# Altium schematic sheet MCU.SchDoc
size A3; SheetNumber: 4; SheetTotal: 7
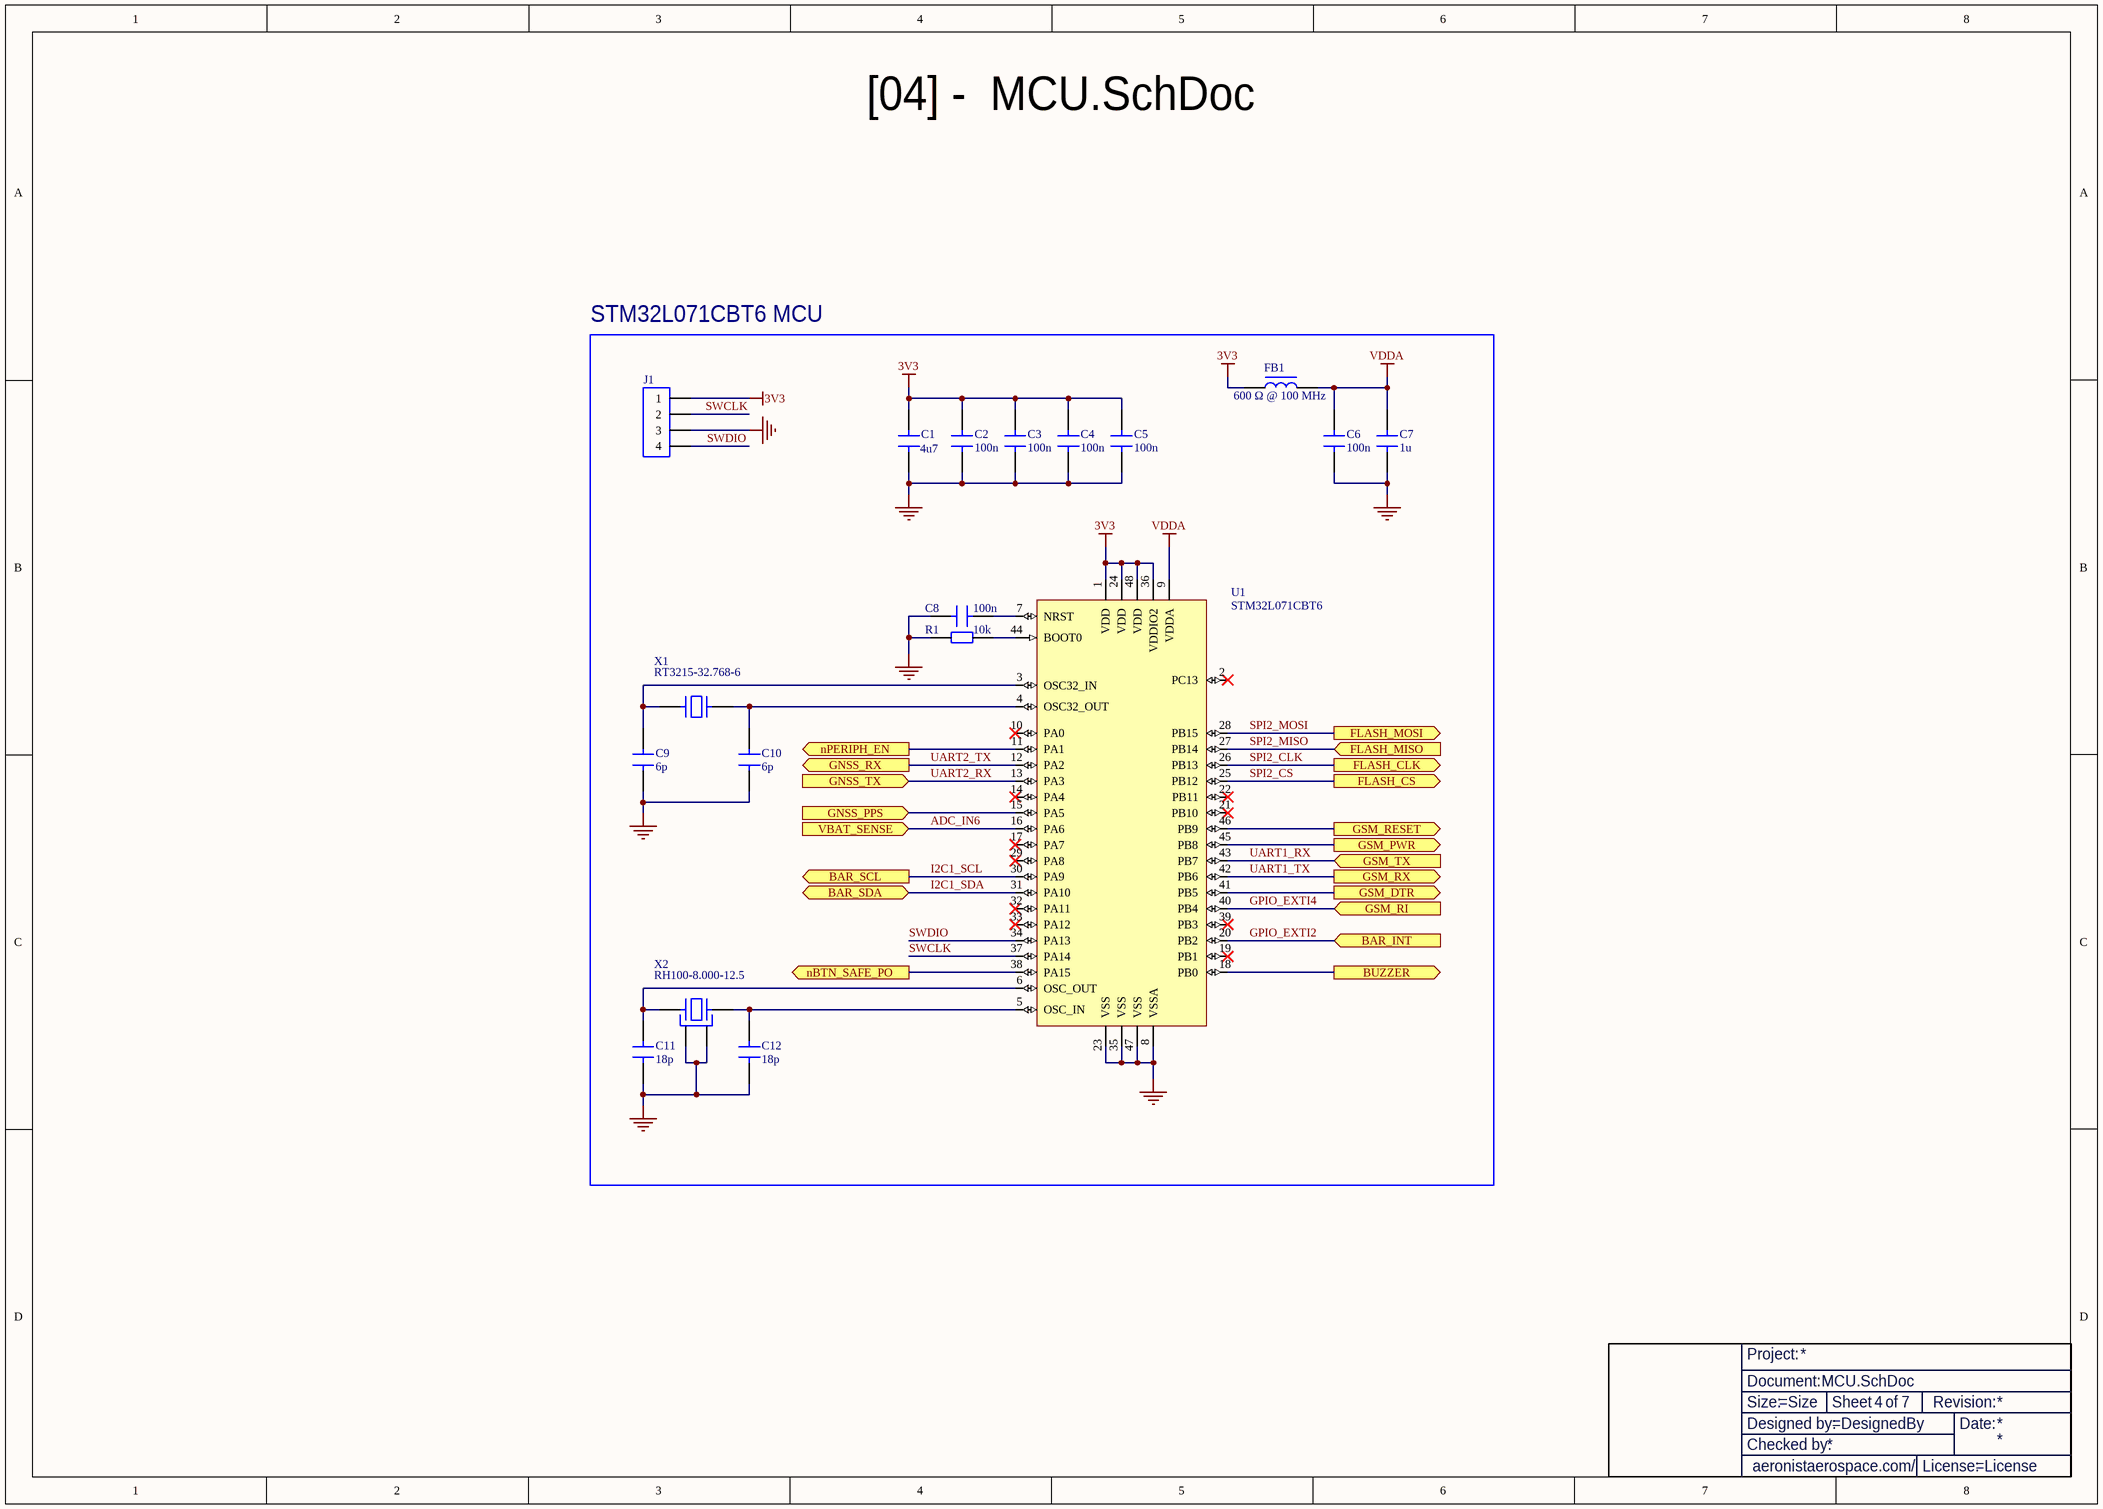
[diagram p0: MCU.SchDoc]

## Parts
?  Title Block  (value not drawn)  (graphical)
C1  4u7  [CAP 0603]
C2  100n  [CAP 0402]
C3  100n  [CAP 0402]
C4  100n  [CAP 0402]
C5  100n  [CAP 0402]
C6  100n  [CAP 0402]
C7  1u  [CAP 0603]
C8  100n  [CAP 0402]
C9  6p  [CAP 0402]
C10  6p  [CAP 0402]
C11  18p  [CAP 0402]
C12  18p  [CAP 0402]
FB1  600 Ω @ 100 MHz  [FB 0402]
J1  CONN 1x4 Pad 1.27mm  [CONN 1x4 PAD 1.27mm]  (value not drawn)
R1  10k  [RES 0402]
U1  STM32L071CBT6  [LQFP48]
X1  RT3215-32.768-6  [RT3215-32.768-X]
X2  RH100-8.000-12.5  [RH100]

## Blocks framed on the sheet
STM32L071CBT6 MCU: C1-C12 FB1 J1 R1 U1 X1 X2

## Ports
BAR_INT (in, see Peripherals[2C]), BAR_SCL (out, see Peripherals[4C]), BAR_SDA (bidir, see Peripherals[4C]), BUZZER (out, see Peripherals[5C]), FLASH_CLK (out, see Peripherals[5B]), FLASH_CS (out, see Peripherals[5B]), FLASH_MISO (in, see Peripherals[5B]), FLASH_MOSI (out, see Peripherals[5B]), GNSS_PPS (in, see Peripherals[3B]), GNSS_RX (out, see Peripherals[3B]), GNSS_TX (in, see Peripherals[3B]), GSM_DTR (out, see Telemetry[5D]), GSM_PWR (out, see Telemetry[5B]), GSM_RESET (out, see Telemetry[5C]), GSM_RI (in, see Telemetry[5D]), GSM_RX (out, see Telemetry[5D]), GSM_TX (in, see Telemetry[5D]), nBTN_SAFE_PO (out, see Telemetry[4C]), nPERIPH_EN (out, see Power[7C]), VBAT_SENSE (in, see Power[5C])

## Nets
3V3: C1.2 C2.2 C3.2 C4.2 C5.2 FB1.2 J1.1 U1.1(VDD) U1.24(VDD) U1.36(VDDIO2) U1.48(VDD)
GND: C1.1 C2.1 C3.1 C4.1 C5.1 C6.1 C7.1 C8.2 C9.1 C10.1 C11.1 C12.1 J1.3 R1.2 U1.8(VSSA) U1.23(VSS) U1.35(VSS) U1.47(VSS) X2.2(GND) X2.4(GND)
VDDA: C6.2 C7.2 FB1.1 U1.9(VDDA)
ADC_IN6: U1.16(PA6) ; port VBAT_SENSE
BUZZER: U1.18(PB0) ; port BUZZER
GNSS_PPS: U1.15(PA5) ; port GNSS_PPS
GPIO_EXTI2: U1.20(PB2) ; port BAR_INT
GPIO_EXTI4: U1.40(PB4) ; port GSM_RI
GSM_DTR: U1.41(PB5) ; port GSM_DTR
GSM_PWR: U1.45(PB8) ; port GSM_PWR
GSM_RESET: U1.46(PB9) ; port GSM_RESET
I2C1_SCL: U1.30(PA9) ; port BAR_SCL
I2C1_SDA: U1.31(PA10) ; port BAR_SDA
nBTN_SAFE_PO: U1.38(PA15) ; port nBTN_SAFE_PO
nPERIPH_EN: U1.11(PA1) ; port nPERIPH_EN
SPI2_CLK: U1.26(PB13) ; port FLASH_CLK
SPI2_CS: U1.25(PB12) ; port FLASH_CS
SPI2_MISO: U1.27(PB14) ; port FLASH_MISO
SPI2_MOSI: U1.28(PB15) ; port FLASH_MOSI
SWCLK: J1.2 U1.37(PA14)
SWDIO: J1.4 U1.34(PA13)
UART1_RX: U1.43(PB7) ; port GSM_TX
UART1_TX: U1.42(PB6) ; port GSM_RX
UART2_RX: U1.13(PA3) ; port GNSS_TX
UART2_TX: U1.12(PA2) ; port GNSS_RX
NetC8_1: C8.1 U1.7(NRST)
NetC9_2: C9.2 U1.3(OSC32_IN) X1.1
NetC10_2: C10.2 U1.4(OSC32_OUT) X1.2
NetC11_2: C11.2 U1.6(OSC_OUT) X2.1
NetC12_2: C12.2 U1.5(OSC_IN) X2.3
NetR1_1: R1.1 U1.44(BOOT0)

Not connected (* = marked no-connect by the designer): U1 2(PC13)* 10(PA0)* 14(PA4)* 17(PA7)* 19(PB1)* 21(PB10)* 22(PB11)* 29(PA8)* 32(PA11)* 33(PA12)* 39(PB3)*

## Notes on the sheet
- [04] -  MCU.SchDoc
- (in symbol Title Block) Project:; Document:; Size:; Sheet; of; Revision:; Designed by:; Date:; Checked by:; aeronistaerospace.com/; License:

## Library data of the parts
C1 C7 = CAP 0603: Capacitor SMD 0603
C2-C6 C8-C12 = CAP 0402: Capacitor SMD 0402
FB1 = FB 0402: Ferrite Bead SMD 0402
J1 = CONN 1x4 Pad 1.27mm: 1×4 pin header connector, 1.27 mm pitch.
R1 = RES 0402: Resistor SMD 0402
U1 = STM32L071CBT6: MCU 32-Bit Ultra Low Power STM32L ARM Cortex M0+ RISC 128kB Flash 48-Pin LQFP Tray; Manufacturer: STMicroelectronics; Core Architecture: ARM Cortex-M0+; Data Bus Width: 32b; EEPROM Memory Size: 6kB; Frequency: 32MHz; Interface: I2S; Max Junction Temperature (Tj): 105°C; Max Power Dissipation: 370mW; Max Supply Voltage: 3.6V; Min Supply Voltage: 1.65V; Nominal Supply Current: 290nA; Number of A/D Converters: 1; Number of ADC Channels: 13; Number of Channels: 10; Number of I2C Channels: 2; Number of I/Os: 37; Number of PWM Channels: 4; Number of Timers/Counters: 8; Operating Supply Voltage: 3V; Peripherals: POR; RAM Size: 20kB; Watchdog Timer: Yes; Supplier: Farnell; Supplier Part Number: 2518142; Manufacturer Part Number: STM32L071CBT6; RoHS: Compliant; Category: Microcontrollers; Stock: 10105; Pricing: 1=3,31, 10=2,59, 25=2,41, 50=2,29, 100=2,07, 250=1,97, 500=1,9, 1000=1,74 (EUR); Ambient Temperature Range High: 85°C; Case/Package: LQFP; China RoHS: Compliant; Flash Memory Size: 128kB; Height: 1.6mm; Height - Seated (Max): 1.6mm; Lead Free: Lead Free; Length: 7mm; Lifecycle Status: Production; Clock Frequency: 32MHz; Max Operating Temperature: 85°C; Memory Size: 128kB; Memory Format: FLASH; Min Operating Temperature: -40°C; Mounting Technology: Surface Mount; Pins: 48; Number of Programmable I/O: 37; Number of SPI Channels: 2; Number of Terminals: 48; Number of UART Channels: 1; Number of USART Channels: 4; REACH SVHC: Yes; Schedule B: 8542310000; Terminal Pitch: 500µm; Width: 7mm; ComponentLink1URL: https://datasheet.octopart.com:443/STM32L071CBT6-STMicroelectronics-datasheet-137481386.pdf?src-supplier=IHS; ComponentLink1Description: https://datasheet.octopart.com:443/STM32L071CBT6-STMicroelectronics-datasheet-137481386.pdf?src-supplier=IHS; ComponentLink2URL: https://datasheet.octopart.com:443/STM32L071CBT6-STMicroelectronics-datasheet-113139635.pdf?src-supplier=ODG+(Origin+Data+Global); ComponentLink2Description: https://datasheet.octopart.com:443/STM32L071CBT6-STMicroelectronics-datasheet-113139635.pdf?src-supplier=ODG+(Origin+Data+Global); ComponentLink3URL: https://datasheet.octopart.com:443/STM32L071CBT6-STMicroelectronics-datasheet-62336796.pdf?src-supplier=SHENGYU+ELECTRONICS; ComponentLink3Description: https://datasheet.octopart.com:443/STM32L071CBT6-STMicroelectronics-datasheet-62336796.pdf?src-supplier=SHENGYU+ELECTRONICS; ComponentLink4URL: https://datasheet.octopart.com:443/STM32L071CBT6-STMicroelectronics-datasheet-49624918.pdf?src-supplier=Newark; ComponentLink4Description: https://datasheet.octopart.com:443/STM32L071CBT6-STMicroelectronics-datasheet-49624918.pdf?src-supplier=Newark
X1 = RT3215-32.768-X: Parallel - Fundamental Quartz Crystal, 0.032768MHz Nom; Manufacturer: Raltron Electronics; Manufacturer Part Number: RT3215-32.768-12.5-TR; Manufacturer Lifecycle Status: ACTIVE; Value: 12.5pF; Frequency: 32.768kHz; Frequency Stability: 144ppm; Frequency Tolerance: 0.002%; ESR: 70kΩ; Supplier: Arrow Electronics; Supplier Part Number: RT3215-32.768-12.5-TR; RoHS: Compliant; Category: Crystals; Stock: 108000; Pricing: 3000=0,2828, 6000=0,28, 9000=0,276, 15000=0,188, 21000=0,154, 30000=0,152 (USD); China RoHS: Compliant; Lead Free: Lead Free; Lifecycle Status: Production; Load Capacitance: 12.5pF; Max Operating Temperature: 85°C; Min Operating Temperature: -40°C; Mounting Technology: Surface Mount; REACH SVHC: Yes; Schedule B: 8541600080, 8541600080|8541600080|8541600080|8541600080|8541600080; Tolerance: 0.002%; ComponentLink1URL: https://datasheet.octopart.com:443/RT3215-32.768-12.5-TR-Raltron-Electronics-datasheet-181182521.pdf?src-supplier=IHS; ComponentLink1Description: https://datasheet.octopart.com:443/RT3215-32.768-12.5-TR-Raltron-Electronics-datasheet-181182521.pdf?src-supplier=IHS; ComponentLink2URL: https://datasheet.octopart.com:443/RT3215-32.768-12.5-TR-Raltron-Electronics-datasheet-140255155.pdf?src-supplier=Raltron+Electronics; ComponentLink2Description: https://datasheet.octopart.com:443/RT3215-32.768-12.5-TR-Raltron-Electronics-datasheet-140255155.pdf?src-supplier=Raltron+Electronics; ComponentLink3URL: https://datasheet.octopart.com:443/RT3215-32.768-12.5-TR-Raltron-Electronics-datasheet-137126748.pdf?src-supplier=Future+Electronics; ComponentLink3Description: https://datasheet.octopart.com:443/RT3215-32.768-12.5-TR-Raltron-Electronics-datasheet-137126748.pdf?src-supplier=Future+Electronics; ComponentLink4URL: https://datasheet.octopart.com:443/RT3215-32.768-12.5-TR-Raltron-Electronics-datasheet-82614827.pdf?src-supplier=Future+Electronics; ComponentLink4Description: https://datasheet.octopart.com:443/RT3215-32.768-12.5-TR-Raltron-Electronics-datasheet-82614827.pdf?src-supplier=Future+Electronics; ComponentLink5URL: https://datasheet.octopart.com:443/RT3215-32.768-12.5-TR-Raltron-Electronics-datasheet-62112304.pdf?src-supplier=Future+Electronics; ComponentLink5Description: https://datasheet.octopart.com:443/RT3215-32.768-12.5-TR-Raltron-Electronics-datasheet-62112304.pdf?src-supplier=Future+Electronics; ComponentLink6URL: https://datasheet.octopart.com:443/RT3215-32.768-12.5-TR-Raltron-Electronics-datasheet-12522443.pdf?src-supplier=Future+Electronics; ComponentLink6Description: https://datasheet.octopart.com:443/RT3215-32.768-12.5-TR-Raltron-Electronics-datasheet-12522443.pdf?src-supplier=Future+Electronics
X2 = RH100-X-X: RH100 Series Crystal, X Mhz, X pF, Smd, 3.2Mm X 2.5Mm Raltron